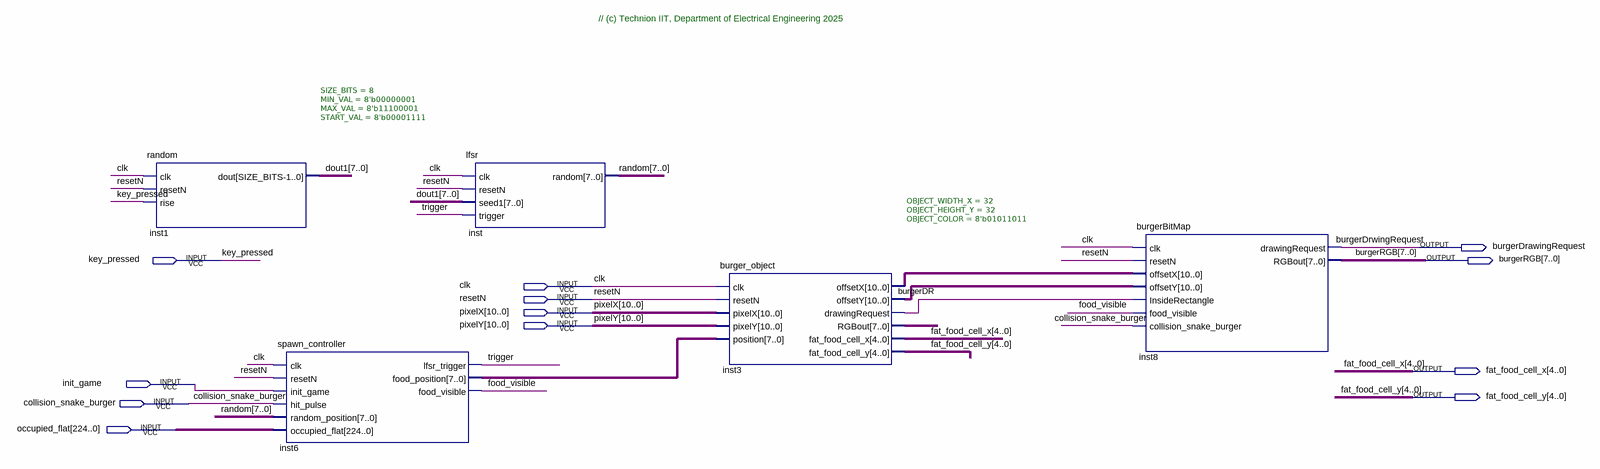
[diagram p0: schematic sheet]
// Quartus schematic burger_display.bdf as structural Verilog: 5 symbols, 12 pins
module burger_display (
  input  key_pressed,
  input  clk,
  input  resetN,
  input  [10:0] pixelX,
  input  [10:0] pixelY,
  input  init_game,
  input  collision_snake_burger,
  input  [224:0] occupied_flat,
  output burgerDrawingRequest,
  output [7:0] burgerRGB,
  output [4:0] fat_food_cell_x,
  output [4:0] fat_food_cell_y
);

  wire burgerDR, food_visible, trigger;
  wire [7:0] dout1, inst3_rgbout, inst6_food_position, random;
  wire [10:0] inst3_offsetx, inst3_offsety;

  random #(.SIZE_BITS(8), .MIN_VAL(8'b00000001), .MAX_VAL(8'b11100001), .START_VAL(8'b00001111)) inst1 (
    .clk(clk), .resetN(resetN), .rise(key_pressed), .dout(dout1));
  spawn_controller inst6 (
    .clk(clk), .resetN(resetN), .init_game(init_game), .hit_pulse(collision_snake_burger),
    .random_position(random), .occupied_flat(occupied_flat), .lfsr_trigger(trigger),
    .food_position(inst6_food_position), .food_visible(food_visible));
  lfsr inst (.clk(clk), .resetN(resetN), .seed1(dout1), .trigger(trigger), .random(random));
  burger_object #(.OBJECT_WIDTH_X(32), .OBJECT_HEIGHT_Y(32), .OBJECT_COLOR(8'b01011011)) inst3 (
    .clk(clk), .resetN(resetN), .pixelX(pixelX), .pixelY(pixelY), .position(inst6_food_position),
    .offsetX(inst3_offsetx), .offsetY(inst3_offsety), .drawingRequest(burgerDR), .RGBout(inst3_rgbout),
    .fat_food_cell_x(fat_food_cell_x), .fat_food_cell_y(fat_food_cell_y));
  burgerBitMap inst8 (
    .clk(clk), .resetN(resetN), .offsetX(inst3_offsetx), .offsetY(inst3_offsety), .InsideRectangle(burgerDR),
    .food_visible(food_visible), .collision_snake_burger(collision_snake_burger),
    .drawingRequest(burgerDrawingRequest), .RGBout(burgerRGB));

  // Other names for the same wires on the sheet: burgerDrwingRequest = burgerDrawingRequest

  // Notes on the sheet:
  //   // (c) Technion IIT, Department of Electrical Engineering 2025
endmodule
